# EasyEDA Pro project SOP100E 2025.05.27.eprj, board PCB3
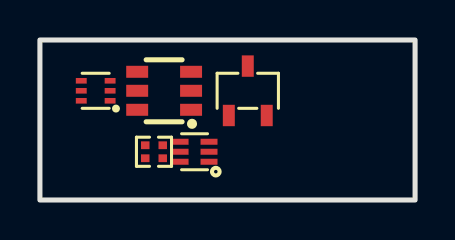
[diagram p19: board, top side]
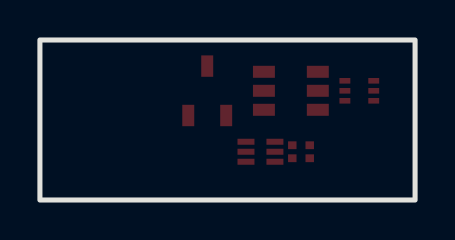
[diagram p20: board, bottom side, seen from below]

Outline 18.8 x 8 mm; copper layers: Top Layer, Bottom Layer. Coordinates in mm from the lower left corner of the outline.
Outline path: rectangle 0,8 18.8,0
Stack: Top Layer 0.035mm / Dielectric1 1.51mm FR4 er 4.5 / Bottom Layer 0.035mm

## Design rules (mm)
template: JLCPCB Capability(Two Layers Board)
spacing copperThickness1oz (default): track to track 0.102, other pairs 0.152 to 0.3
spacing copperThickness2oz: track to track 0.203, other pairs 0.152 to 0.3
track width copperThickness1oz (default): min 0.127, default 0.254, max 2.54
track width copperThickness2oz: min 0.203, default 0.254, max 2.54
differential pair differentialPair (default): width min 0.127, default 0.254, max 2.54; gap min 0.152, default 0.152
via viaSize (default): diameter min 0.5, default 0.61, max 10; hole min 0.3, default 0.305, max 6.3

## Placement (name value [footprint] x y rotation side)
D47  BAT54VV,115  [SOT-666-6_L1.6-W1.2-P0.50-LS1.6-BR]  7.75 2.41 0 top
D48  BAT54V-7  [SOT-563_L1.6-W1.2-P0.50-LS1.6-BL]  2.79 5.46 90 top
RN1  4.7kΩ  [RES-ARRAY-SMD_0402-4P-L1.0-W1.0-BL]  5.72 2.41 180 top
U1  CH213B  [SOT-23-6_L2.9-W1.6-P0.95-LS2.8-BR]  6.22 5.46 0 top
U2  CH213K  [SOT-23-3_L2.9-W1.6-P1.90-LS2.8-BR]  10.41 5.46 270 top

## Footprints (pads in the part's own frame, mm; a bottom-side part is the same pattern mirrored in y, then rotated)
RES-ARRAY-SMD_0402-4P-L1.0-W1.0-BL
  rect 0.425x0.39 smd: 1(-0.438,-0.325) 2(-0.438,0.325) 3(0.438,0.325) 4(0.438,-0.325)
SOT-23-3_L2.9-W1.6-P1.90-LS2.8-BR
  rect 1.07x0.6 smd: 1(1.235,-0.95) 2(1.235,0.95) 3(-1.235,0)
SOT-23-6_L2.9-W1.6-P0.95-LS2.8-BR
  rect 1.1x0.6 smd: 1(1.35,-0.95) 2(1.35,0) 3(1.35,0.95) 4(-1.35,0.95) 5(-1.35,0) 6(-1.35,-0.95)
SOT-563_L1.6-W1.2-P0.50-LS1.6-BL
  rect 0.28x0.545 smd: 1(-0.5,-0.723) 2(0,-0.723) 3(0.5,-0.723) 4(0.5,0.723) 5(0,0.723) 6(-0.5,0.723)
SOT-666-6_L1.6-W1.2-P0.50-LS1.6-BR
  rect 0.85x0.3 smd: 1(0.725,-0.5) 2(0.725,0) 3(0.725,0.5) 4(-0.725,0.5) 5(-0.725,0) 6(-0.725,-0.5)

## Nets
As in the schematic.

Pads without a net: D47 1 2 3 4 5 6; D48 1 2 3 4 5 6; RN1 1 2 3 4; U1 1 2 3 4 5 6; U2 1 2 3
